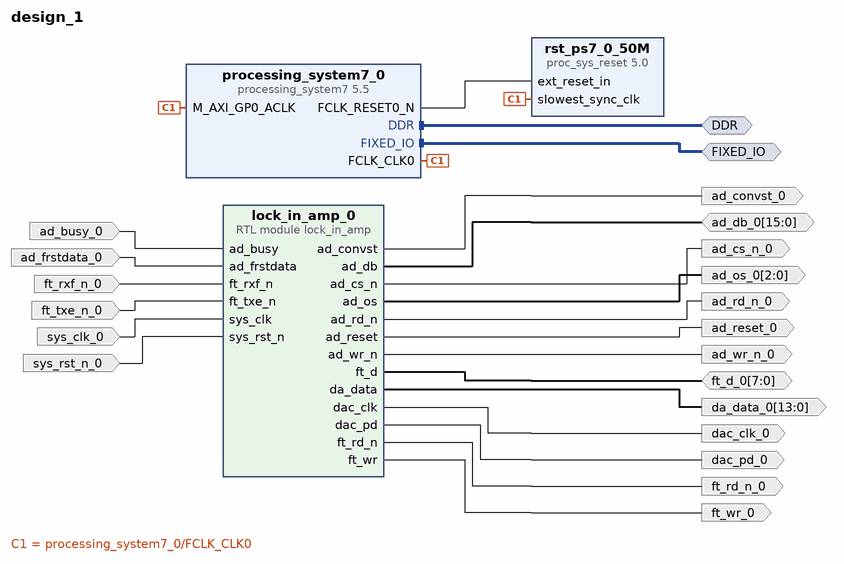
[diagram p0: block diagram of the top level]
# Vivado block design design_1, xc7z020clg484-2, Vivado 2025.1
create_bd_design design_1

create_bd_intf_port -mode Master -vlnv xilinx.com:interface:ddrx_rtl:1.0 DDR
create_bd_intf_port -mode Master -vlnv xilinx.com:display_processing_system7:fixedio_rtl:1.0 FIXED_IO
create_bd_port -dir O -from 13 -to 0 da_data_0
create_bd_port -dir O -type clk dac_clk_0
create_bd_port -dir O dac_pd_0
create_bd_port -dir IO -from 7 -to 0 ft_d_0
create_bd_port -dir O ft_rd_n_0
create_bd_port -dir I ft_rxf_n_0
create_bd_port -dir I ft_txe_n_0
create_bd_port -dir O ft_wr_0
create_bd_port -dir I -type rst sys_rst_n_0
create_bd_port -dir I -type clk sys_clk_0
set_property -dict {CONFIG.FREQ_HZ 50000000} [get_bd_ports sys_clk_0]
create_bd_port -dir IO -from 15 -to 0 ad_db_0
create_bd_port -dir O ad_convst_0
create_bd_port -dir O ad_wr_n_0
create_bd_port -dir O ad_rd_n_0
create_bd_port -dir O ad_cs_n_0
create_bd_port -dir O -type rst ad_reset_0
create_bd_port -dir O -from 2 -to 0 ad_os_0
create_bd_port -dir I ad_busy_0
create_bd_port -dir I ad_frstdata_0

create_bd_cell -type ip -vlnv xilinx.com:ip:processing_system7:5.5 processing_system7_0
set_property -dict [list \
  CONFIG.PCW_PRESET_BANK1_VOLTAGE {LVCMOS 1.8V} \
  CONFIG.PCW_QSPI_GRP_SINGLE_SS_ENABLE 1 \
  CONFIG.PCW_QSPI_GRP_SINGLE_SS_IO {MIO 1 .. 6} \
  CONFIG.PCW_QSPI_PERIPHERAL_ENABLE 1 \
  CONFIG.PCW_QSPI_QSPI_IO {MIO 1 .. 6} \
  CONFIG.PCW_SD0_GRP_CD_ENABLE 1 \
  CONFIG.PCW_SD0_GRP_CD_IO {MIO 47} \
  CONFIG.PCW_SD0_GRP_WP_ENABLE 0 \
  CONFIG.PCW_SD0_PERIPHERAL_ENABLE 1 \
  CONFIG.PCW_SD0_SD0_IO {MIO 40 .. 45} \
  CONFIG.PCW_SDIO_PERIPHERAL_FREQMHZ 100 \
  CONFIG.PCW_SINGLE_QSPI_DATA_MODE x4 \
  CONFIG.PCW_UART1_PERIPHERAL_ENABLE 1 \
  CONFIG.PCW_UART1_UART1_IO {MIO 48 .. 49} \
  CONFIG.PCW_UART_PERIPHERAL_FREQMHZ 100 \
  CONFIG.PCW_UIPARAM_DDR_BUS_WIDTH {16 Bit} \
  CONFIG.PCW_UIPARAM_DDR_PARTNO {MT41J256M16 RE-125} \
] [get_bd_cells processing_system7_0]
# 85 more settings of processing_system7_0 are not shown: defaults, MIO pin electricals, DDR timing, and values the tool derives
create_bd_cell -type module -reference lock_in_amp lock_in_amp_0
create_bd_cell -type ip -vlnv xilinx.com:ip:proc_sys_reset:5.0 rst_ps7_0_50M

# ---- connections ----

connect_bd_intf_net [get_bd_intf_ports DDR] [get_bd_intf_pins processing_system7_0/DDR]
connect_bd_intf_net [get_bd_intf_ports FIXED_IO] [get_bd_intf_pins processing_system7_0/FIXED_IO]
connect_bd_net [get_bd_ports ad_db_0] [get_bd_pins lock_in_amp_0/ad_db]
connect_bd_net [get_bd_ports ft_d_0] [get_bd_pins lock_in_amp_0/ft_d]
connect_bd_net -net ad_busy_0_1 [get_bd_ports ad_busy_0] [get_bd_pins lock_in_amp_0/ad_busy]
connect_bd_net -net ad_frstdata_0_1 [get_bd_ports ad_frstdata_0] [get_bd_pins lock_in_amp_0/ad_frstdata]
connect_bd_net -net ft_rxf_n_0_1 [get_bd_ports ft_rxf_n_0] [get_bd_pins lock_in_amp_0/ft_rxf_n]
connect_bd_net -net ft_txe_n_0_1 [get_bd_ports ft_txe_n_0] [get_bd_pins lock_in_amp_0/ft_txe_n]
connect_bd_net [get_bd_pins lock_in_amp_0/ad_convst] [get_bd_ports ad_convst_0]
connect_bd_net [get_bd_pins lock_in_amp_0/ad_cs_n] [get_bd_ports ad_cs_n_0]
connect_bd_net [get_bd_pins lock_in_amp_0/ad_os] [get_bd_ports ad_os_0]
connect_bd_net [get_bd_pins lock_in_amp_0/ad_rd_n] [get_bd_ports ad_rd_n_0]
connect_bd_net [get_bd_pins lock_in_amp_0/ad_reset] [get_bd_ports ad_reset_0]
connect_bd_net [get_bd_pins lock_in_amp_0/ad_wr_n] [get_bd_ports ad_wr_n_0]
connect_bd_net [get_bd_pins lock_in_amp_0/da_data] [get_bd_ports da_data_0]
connect_bd_net [get_bd_pins lock_in_amp_0/dac_clk] [get_bd_ports dac_clk_0]
connect_bd_net [get_bd_pins lock_in_amp_0/dac_pd] [get_bd_ports dac_pd_0]
connect_bd_net [get_bd_pins lock_in_amp_0/ft_rd_n] [get_bd_ports ft_rd_n_0]
connect_bd_net [get_bd_pins lock_in_amp_0/ft_wr] [get_bd_ports ft_wr_0]
connect_bd_net [get_bd_pins processing_system7_0/FCLK_CLK0] \
  [get_bd_pins rst_ps7_0_50M/slowest_sync_clk] [get_bd_pins processing_system7_0/M_AXI_GP0_ACLK]
connect_bd_net [get_bd_pins processing_system7_0/FCLK_RESET0_N] [get_bd_pins rst_ps7_0_50M/ext_reset_in]
connect_bd_net -net sys_clk_0_1 [get_bd_ports sys_clk_0] [get_bd_pins lock_in_amp_0/sys_clk]
connect_bd_net -net sys_rst_n_0_1 [get_bd_ports sys_rst_n_0] [get_bd_pins lock_in_amp_0/sys_rst_n]

validate_bd_design
save_bd_design
